# Altium project Oliver_Flst.PrjPcb
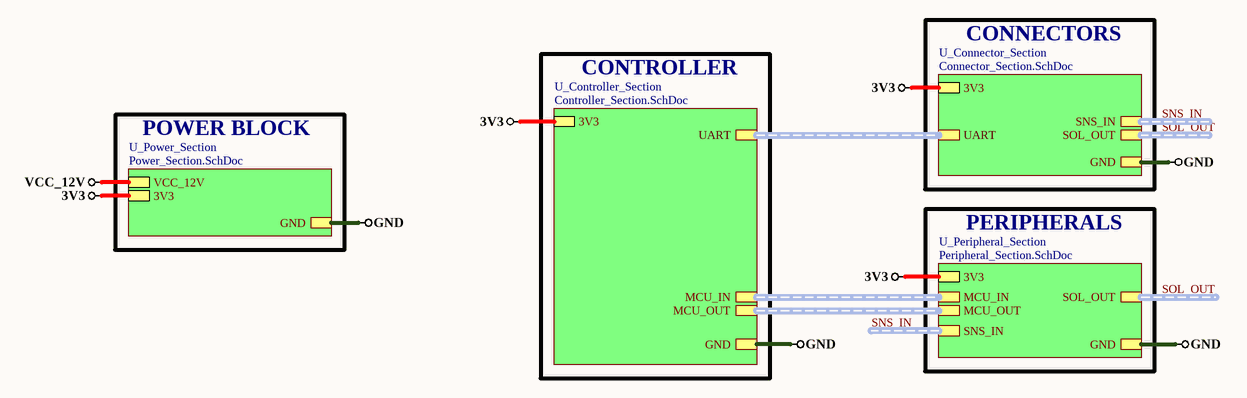
[diagram p0: Top_Sheet.SchDoc]
5 sheets, 47 parts. Net scope: global (net labels, ports and power ports of the same name join across sheets).
Board file: Junction_Box.PcbDoc
Sheets:
  Top_Sheet.SchDoc
    U_Controller_Section = Controller_Section.SchDoc
    U_Peripheral_Section = Peripheral_Section.SchDoc
    U_Power_Section = Power_Section.SchDoc
    U_Connector_Section = Connector_Section.SchDoc

## Sheet Top_Sheet.SchDoc
size A4; DocumentNumber: 1; SheetNumber: 1

### Sub-sheets
U_Connector_Section = Connector_Section.SchDoc: UART (harness UART), 3V3, GND, SNS_IN (harness SNS_IN), SOL_OUT (harness SOL_OUT)
U_Controller_Section = Controller_Section.SchDoc: 3V3, GND, UART (harness UART), MCU_OUT (harness MCU_OUT), MCU_IN (harness MCU_IN)
U_Peripheral_Section = Peripheral_Section.SchDoc: MCU_IN (harness MCU_IN), MCU_OUT (harness MCU_OUT), 3V3, GND, SNS_IN (harness SNS_IN), SOL_OUT (harness SOL_OUT)
U_Power_Section = Power_Section.SchDoc: 3V3, GND, VCC_12V

### Nets
3V3: sheet U_Controller_Section/3V3, sheet U_Peripheral_Section/3V3, sheet U_Power_Section/3V3, sheet U_Connector_Section/3V3
GND: sheet U_Controller_Section/GND, sheet U_Peripheral_Section/GND, sheet U_Power_Section/GND, sheet U_Connector_Section/GND
VCC_12V: sheet U_Power_Section/VCC_12V

### Buses and harness runs
harness sheet U_Connector_Section/UART = sheet U_Controller_Section/UART
harness sheet U_Controller_Section/MCU_IN = sheet U_Peripheral_Section/MCU_IN
harness sheet U_Controller_Section/MCU_OUT = sheet U_Peripheral_Section/MCU_OUT
harness SNS_IN = sheet U_Connector_Section/SNS_IN
harness SNS_IN = sheet U_Peripheral_Section/SNS_IN
harness SOL_OUT = sheet U_Connector_Section/SOL_OUT
harness SOL_OUT = sheet U_Peripheral_Section/SOL_OUT

### Notes on the sheet
- CONTROLLER
- CONNECTORS
- POWER BLOCK
- PERIPHERALS

## Sheet Controller_Section.SchDoc
size A4; DocumentNumber: 3; SheetNumber: 3
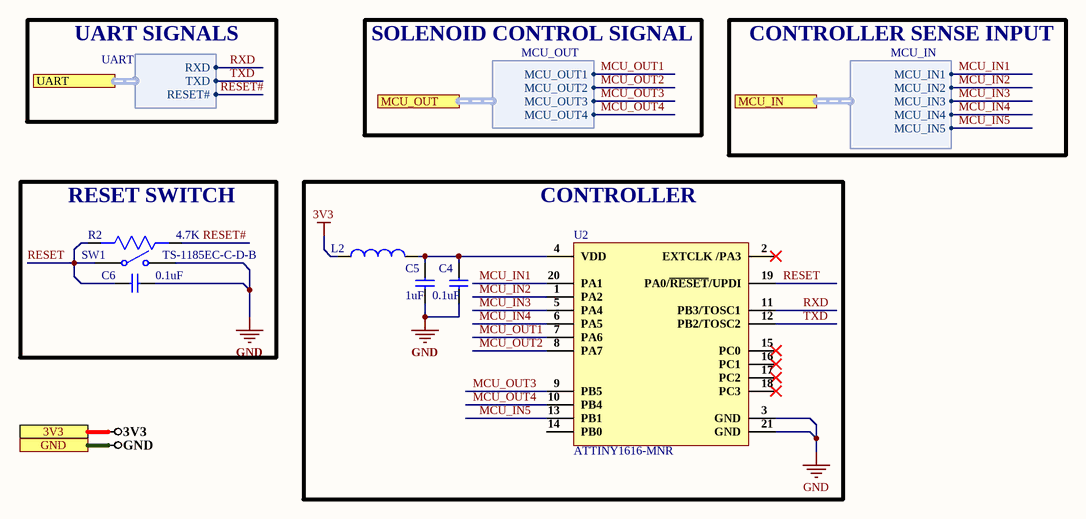
[diagram p1: Controller_Section.SchDoc]

### Parts
C4  0.1uF  [Cap0603]
C5  1uF  [Cap0603]
C6  0.1uF  [Cap0603]
L2  MMZ0603S601CT000  [IND 0201]  (value not drawn)
R2  4.7K  [RES-0603]
SW1  TS-1185EC-C-D-B  [TS-1185EC-C-D-B]
U2  ATTINY1616-MNR  [20-QFN]

### Blocks framed on the sheet
RESET SWITCH: C6 R2 SW1
CONTROLLER: C4 C5 L2 U2

### Ports
3V3, GND, MCU_IN (harness MCU_IN), MCU_OUT (harness MCU_OUT), UART (harness UART)

### Harnesses
UART: RXD, TXD, RESET#
MCU_IN: MCU_IN1, MCU_IN2, MCU_IN3, MCU_IN4, MCU_IN5
MCU_OUT: MCU_OUT1, MCU_OUT2, MCU_OUT3, MCU_OUT4

### Nets
3V3: L2.1 ; port 3V3
GND: C4.1 C5.1 C6.2 SW1.2 U2.3(GND) U2.21(GND) ; port GND
MCU_IN1: U2.20(PA1) ; port MCU_IN.MCU_IN1
MCU_IN2: U2.1(PA2) ; port MCU_IN.MCU_IN2
MCU_IN3: U2.5(PA4) ; port MCU_IN.MCU_IN3
MCU_IN4: U2.6(PA5) ; port MCU_IN.MCU_IN4
MCU_IN5: U2.13(PB1) ; port MCU_IN.MCU_IN5
MCU_OUT1: U2.7(PA6) ; port MCU_OUT.MCU_OUT1
MCU_OUT2: U2.8(PA7) ; port MCU_OUT.MCU_OUT2
MCU_OUT3: U2.9(PB5) ; port MCU_OUT.MCU_OUT3
MCU_OUT4: U2.10(PB4) ; port MCU_OUT.MCU_OUT4
RESET: C6.1 R2.2 SW1.1 U2.19(PA0/~{RESET}/UPDI)
RESET#: R2.1 ; port UART.RESET#
RXD: U2.11(PB3/TOSC1) ; port UART.RXD
TXD: U2.12(PB2/TOSC2) ; port UART.TXD
NetC4_2: C4.2 C5.2 L2.2 U2.4(VDD)

Not connected (* = marked no-connect by the designer): U2 2(EXTCLK_/PA3)* 14(PB0) 15(PC0)* 16(PC1)* 17(PC2)* 18(PC3)*

### Notes on the sheet
- UART SIGNALS
- SOLENOID CONTROL SIGNAL
- CONTROLLER SENSE INPUT

### Library data of the parts
C4 C6 = CC0603ZRY5V9BB104: CAP CER 0.1UF 50V Y5V 0603; Manufacturer: Yageo; Capacitance: 100nF; Tolerance: 80%; Supplier 1: Digi-Key; Manufacturer Part Number: CC0603ZRY5V9BB104; Stock 1: 15000880; Pricing 1: 1=0.1, 10=0.075, 100=0.0334, 500=0.02386, 1000=0.01874 (USD); Mount: Surface Mount; Case/Package: 0603; Number of Pins: 2; Case Code (Metric): 1608; Case Code (Imperial): 0603; Min Operating Temperature: -30°C; Max Operating Temperature: 85°C; Dielectric: Y5V; Voltage Rating: 50V; Package Quantity: 1; Packaging: Tape and Reel; Voltage Rating (DC): 50V; Termination: SMD/SMT; Composition: Ceramic; Voltage: 50V; Length: 1.6mm; Height: 0.8mm; Width: 0.031inch; Thickness: 0.035inch; Depth: 0.8mm; Radiation Hardening: No; REACH SVHC: No SVHC; Lead Free: Lead Free; Halogen Free: Halogen Free; ComponentLink1URL: http://www.yageo.com/documents/recent/UPY-GPHC_Y5V_6.3V-to-50V_8.pdf?src-supplier=Digi-Key; ComponentLink1Description: http://www.yageo.com/documents/recent/UPY-GPHC_Y5V_6.3V-to-50V_8.pdf?src-supplier=Digi-Key; ComponentLink2URL: http://www.yageo.com/documents/recent/UPY-GPHC_Y5V_6.3V-to-50V_5.pdf?src-supplier=Avnet+Europe; ComponentLink2Description: http://www.yageo.com/documents/recent/UPY-GPHC_Y5V_6.3V-to-50V_5.pdf?src-supplier=Avnet+Europe; ComponentLink3URL: https://www.verical.com/server-webapp/html/getDatasheet?partID=403611&src-supplier=Verical; ComponentLink3Description: https://www.verical.com/server-webapp/html/getDatasheet?partID=403611&src-supplier=Verical; ComponentLink4URL: http://www.mouser.com/ds/2/447/Yageo_UPY-GP_NP0_16V-to-50V_9-358835.pdf?src-supplier=Mouser; ComponentLink4Description: http://www.mouser.com/ds/2/447/Yageo_UPY-GP_NP0_16V-to-50V_9-358835.pdf?src-supplier=Mouser; ComponentLink5URL: http://www.farnell.com/datasheets/1132289.pdf?src-supplier=Element14; ComponentLink5Description: http://www.farnell.com/datasheets/1132289.pdf?src-supplier=Element14; Supplier Part Number 1: 311-1343-1-ND
C5 = CC0603KRX5R8BB105: CAP CER 1UF 25V X5R 0603; Manufacturer: Yageo; Tolerance: 10%; Supplier 1: Digi-Key; Manufacturer Part Number: CC0603KRX5R8BB105; Stock 1: 1419041; Pricing 1: 1=0.1, 10=0.069, 100=0.0307, 500=0.0219, 1000=0.0172 (USD); Mount: Surface Mount; Case/Package: 0603; Number of Pins: 2; Case Code (Metric): 1608; Case Code (Imperial): 0603; Min Operating Temperature: -55°C; Max Operating Temperature: 85°C; Capacitance: 1uF; Dielectric: X5R; Package Quantity: 1; Voltage Rating: 25V; Packaging: Tape and Reel; Termination: SMD/SMT; Voltage Rating (DC): 25V; Length: 1.6mm; Height: 0.8mm; Width: 0.031inch; Thickness: 0.035inch; Depth: 0.8mm; Radiation Hardening: No; REACH SVHC: No SVHC; Lead Free: Lead Free; Halogen Free: Halogen Free; ComponentLink1URL: http://www.yageo.com/documents/recent/UPY-GPHC_X5R_4V-to-50V_25.pdf?src-supplier=Digi-Key; ComponentLink1Description: http://www.yageo.com/documents/recent/UPY-GPHC_X5R_4V-to-50V_25.pdf?src-supplier=Digi-Key; ComponentLink2URL: http://www.yageo.com/documents/recent/UPY-GPHC_X5R_4V-to-50V_12.pdf?src-supplier=Avnet+Europe; ComponentLink2Description: http://www.yageo.com/documents/recent/UPY-GPHC_X5R_4V-to-50V_12.pdf?src-supplier=Avnet+Europe; ComponentLink3URL: http://www.farnell.com/datasheets/1525783.pdf?src-supplier=Element14; ComponentLink3Description: http://www.farnell.com/datasheets/1525783.pdf?src-supplier=Element14; ComponentLink4URL: http://www.yageo.com/documents/recent/UPY-GPHC_X5R_4V-to-50V_12.pdf?src-supplier=Avnet; ComponentLink4Description: http://www.yageo.com/documents/recent/UPY-GPHC_X5R_4V-to-50V_12.pdf?src-supplier=Avnet; Supplier Part Number 1: 311-1445-6-ND
L2 = MMZ0603S601CT000: FERRITE BEAD 600 OHM 0201 1LN; Manufacturer: TDK; Impedance: 600R; Tolerance: 25%; DC Resistance (DCR): 1.45R; Max DC Current: 100mA; Supplier 1: Digi-Key; Manufacturer Part Number: MMZ0603S601CT000; RoHS: Yes; Category: Inductors; Stock 1: 1540; Pricing 1: 1=0.12000, 10=0.09900, 25=0.07680, 50=0.06380, 100=0.05500, 250=0.04400, 500=0.03960, 1000=0.03300, 5000=0.03080 (USD); Mount: Surface Mount; Case/Package: 0201; Core Material: Ferrite; Case Code (Metric): 0603; Case Code (Imperial): 0201; Packaging: Cut Tape; Package Quantity: 15000; Current Rating: 100mA; Length: 0.024inch; Width: 0.012inch; Height: 0.013inch; REACH SVHC: No SVHC; Lead Free: Lead Free; RoHS Compliant: Yes; ComponentLink1URL: https://datasheet.ciiva.com/46381/1795294-46381669.pdf?src-supplier=Element14; ComponentLink1Description: https://datasheet.ciiva.com/46381/1795294-46381669.pdf?src-supplier=Element14; ComponentLink2URL: https://datasheet.ciiva.com/46634/beads-commercial-signal-mmz-en-46634390.pdf?src-supplier=Digi-Key; ComponentLink2Description: https://datasheet.ciiva.com/46634/beads-commercial-signal-mmz-en-46634390.pdf?src-supplier=Digi-Key; ComponentLink3URL: https://datasheet.ciiva.com/48682/beads-commercial-signal-mmz-en-48682603.pdf?src-supplier=Avnet; ComponentLink3Description: https://datasheet.ciiva.com/48682/beads-commercial-signal-mmz-en-48682603.pdf?src-supplier=Avnet; ComponentLink4URL: https://datasheet.ciiva.com/46634/beads-commercial-signal-mmz-en-46634381.pdf?src-supplier=Digi-Key; ComponentLink4Description: https://datasheet.ciiva.com/46634/beads-commercial-signal-mmz-en-46634381.pdf?src-supplier=Digi-Key; Supplier Part Number 1: 445-2146-1-ND
R2 = RC0603FR-074K7L: RES SMD 4.7K OHM 1% 1/10W 0603; Manufacturer: Yageo; Resistance: 4.7kR; Temperature Coefficient: 100ppm/°C; Power Rating: 100mW; Voltage Rating (DC): 50V; Supplier 1: Digi-Key; Manufacturer Part Number: RC0603FR-074K7L; RoHS: Yes; Category: Chip SMD Resistors; Stock 1: 1924316; Pricing 1: 1=0.10000, 10=0.02400, 100=0.00970, 1000=0.00436, 2500=0.00378 (USD); Case/Package: 0603; Number of Pins: 2; Case Code (Imperial): 0603; Case Code (Metric): 1608; Size Code: 0603; Min Operating Temperature: -55°C; Max Operating Temperature: 155°C; Tolerance: 1%; Resistor Type: Thick Film; Packaging: Tape and Reel; Voltage Rating: 50V; Termination: SMD/SMT; Features: Moisture Resistant; Series: RC; Max Power Dissipation: 100mW; Number of Terminations: 2; Construction: Rectangular; Resistance Tolerance: 1%; Length: 1.6mm; Width: 0.8mm; Height: 0.45mm; Depth: 0.8mm; Lead Pitch: 0.3mm; REACH SVHC: No SVHC; Lead Free: Lead Free; RoHS Compliant: Yes; Military Standard: Not; ComponentLink1URL: https://datasheet.ciiva.com/15189/getdatasheetpartid-422754-15189760.pdf?src-supplier=Verical; ComponentLink1Description: https://datasheet.ciiva.com/15189/getdatasheetpartid-422754-15189760.pdf?src-supplier=Verical; ComponentLink2URL: https://datasheet.ciiva.com/22747/443971-22747528.pdf?src-supplier=Element14; ComponentLink2Description: https://datasheet.ciiva.com/22747/443971-22747528.pdf?src-supplier=Element14; ComponentLink3URL: https://datasheet.ciiva.com/7660/38590-7660794.pdf?src-supplier=Element14; ComponentLink3Description: https://datasheet.ciiva.com/7660/38590-7660794.pdf?src-supplier=Element14; ComponentLink4URL: https://datasheet.ciiva.com/7746/1868787-7746365.pdf?src-supplier=Element14; ComponentLink4Description: https://datasheet.ciiva.com/7746/1868787-7746365.pdf?src-supplier=Element14; ComponentLink5URL: https://datasheet.ciiva.com/46440/1868787-46440909.pdf?src-supplier=Element14; ComponentLink5Description: https://datasheet.ciiva.com/46440/1868787-46440909.pdf?src-supplier=Element14; ComponentLink6URL: https://datasheet.ciiva.com/7746/1738695-7746366.pdf?src-supplier=Element14; ComponentLink6Description: https://datasheet.ciiva.com/7746/1738695-7746366.pdf?src-supplier=Element14; Supplier Part Number 1: 311-4.70KHRCT-ND
SW1 = TS-1185EC-C-D-B: 3mm 2mm Round Button 50mA Top3.65mm SPST 12V SMD Tactile Switches; Manufacturer: XKB; Manufacturer Part No: TS-1185EC-C-D-B; Package: Custom; ComponentLink1Description: LCSC; ComponentLink1URL: https://lcsc.com/product-detail/Tactile-Switches_XKB-Connectivity-TS-1185EC-C-D-B_C318893.html
U2 = ATTINY1616-MNR: IC MCU 8BIT 16KB FLASH 20VQFN; Manufacturer: Microchip; Interface: I2C,SPI,IrDA,UART,USART; Peripherals: Brown-out Detect/Reset,POR,PWM,WDT; Core Architecture: AVR; Frequency: 20MHz; Number of I/Os: 18; Oscillator Type: Internal; Supplier 1: Digi-Key; Manufacturer Part Number: ATTINY1616-MNR; RoHS: No; Category: Microcontrollers; Stock 1: 3963; Pricing 1: 1=0.75000, 25=0.69000, 100=0.62000 (USD); Case/Package: VQFN; Min Operating Temperature: -40°C; Max Operating Temperature: 105°C; Memory Type: FLASH; Packaging: Cut Tape; Memory Size: 16KB; ComponentLink1URL: http://www.microchip.com/mymicrochip/filehandler.aspx?ddocname=en606269&src-supplier=Digi-Key; ComponentLink1Description: http://www.microchip.com/mymicrochip/filehandler.aspx?ddocname=en606269&src-supplier=Digi-Key; Supplier Part Number 1: ATTINY1616-MNRCT-ND

## Sheet Peripheral_Section.SchDoc
size A4; DocumentNumber: 4; SheetNumber: 4
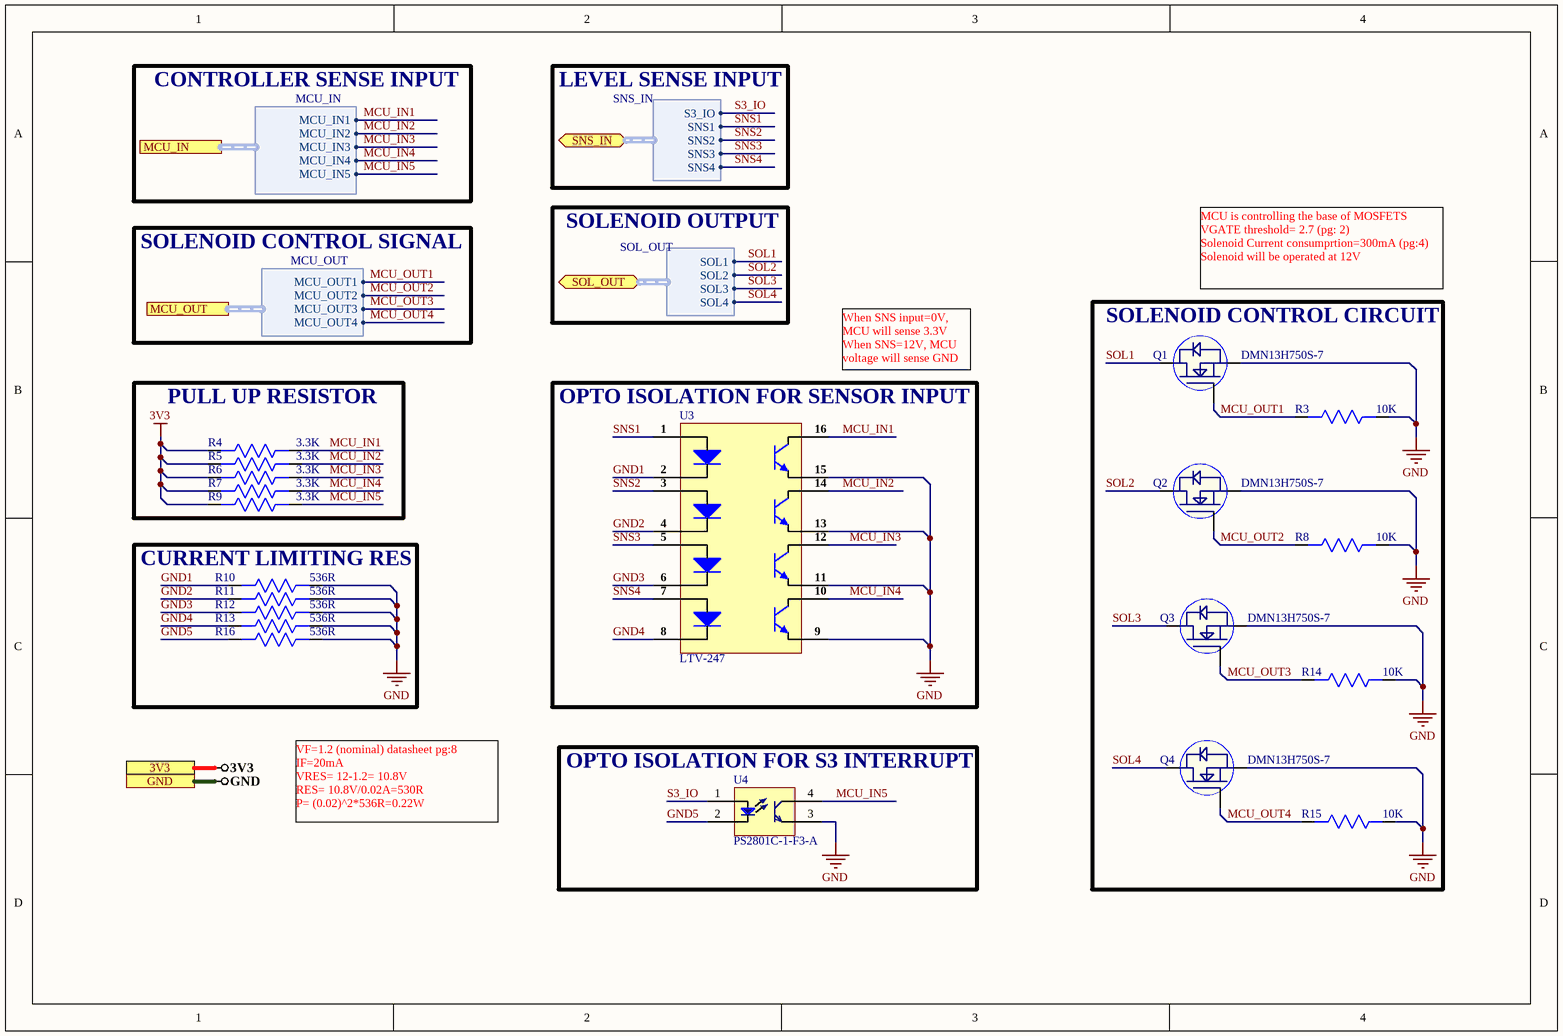
[diagram p2: Peripheral_Section.SchDoc]

### Parts
Q1  DMN13H750S-7  [SOT23-3]
Q2  DMN13H750S-7  [SOT23-3]
Q3  DMN13H750S-7  [SOT23-3]
Q4  DMN13H750S-7  [SOT23-3]
R3  10K  [Res-0201]
R4  3.3K  [RES-0603]
R5  3.3K  [RES-0603]
R6  3.3K  [RES-0603]
R7  3.3K  [RES-0603]
R8  10K  [Res-0201]
R9  3.3K  [RES-0603]
R10  536R  [Res-1206]
R11  536R  [Res-1206]
R12  536R  [Res-1206]
R13  536R  [Res-1206]
R14  10K  [Res-0201]
R15  10K  [Res-0201]
R16  536R  [Res-1206]
U3  LTV-247  [LTV-247]
U4  PS2801C-1-F3-A  [PS2801C-1-F3-A]

### Blocks framed on the sheet
SOLENOID CONTROL CIRCUIT: Q1-Q4 R3 R8 R14 R15
PULL UP RESISTOR: R4-R7 R9
OPTO ISOLATION FOR SENSOR INPUT: U3
CURRENT LIMITING RES: R10-R13 R16
OPTO ISOLATION FOR S3 INTERRUPT: U4

### Ports
3V3, GND, MCU_IN (harness MCU_IN), MCU_OUT (harness MCU_OUT), SNS_IN (bidir, harness SNS_IN), SOL_OUT (bidir, harness SOL_OUT)

### Harnesses
MCU_IN: MCU_IN1, MCU_IN2, MCU_IN3, MCU_IN4, MCU_IN5
MCU_OUT: MCU_OUT1, MCU_OUT2, MCU_OUT3, MCU_OUT4
SNS_IN: S3_IO, SNS1, SNS2, SNS3, SNS4
SOL_OUT: SOL1, SOL2, SOL3, SOL4

### Nets
3V3: R4.2 R5.2 R6.2 R7.2 R9.2 ; port 3V3
GND: Q1.2(S) Q2.2(S) Q3.2(S) Q4.2(S) R3.1 R8.1 R10.1 R11.1 R12.1 R13.1 R14.1 R15.1 R16.1 U3.9(E) U3.11(E) U3.13(E) U3.15(E) U4.3(E) ; port GND
GND1: R10.2 U3.2(K)
GND2: R11.2 U3.4(K)
GND3: R12.2 U3.6(K)
GND4: R13.2 U3.8(K)
GND5: R16.2 U4.2(Ca)
MCU_IN1: R4.1 U3.16(C) ; port MCU_IN.MCU_IN1
MCU_IN2: R5.1 U3.14(C) ; port MCU_IN.MCU_IN2
MCU_IN3: R6.1 U3.12(C) ; port MCU_IN.MCU_IN3
MCU_IN4: R7.1 U3.10(C) ; port MCU_IN.MCU_IN4
MCU_IN5: R9.1 U4.4(C) ; port MCU_IN.MCU_IN5
MCU_OUT1: Q1.1(G) R3.2 ; port MCU_OUT.MCU_OUT1
MCU_OUT2: Q2.1(G) R8.2 ; port MCU_OUT.MCU_OUT2
MCU_OUT3: Q3.1(G) R14.2 ; port MCU_OUT.MCU_OUT3
MCU_OUT4: Q4.1(G) R15.2 ; port MCU_OUT.MCU_OUT4
S3_IO: U4.1(An) ; port SNS_IN.S3_IO
SNS1: U3.1(A) ; port SNS_IN.SNS1
SNS2: U3.3(A) ; port SNS_IN.SNS2
SNS3: U3.5(A) ; port SNS_IN.SNS3
SNS4: U3.7(A) ; port SNS_IN.SNS4
SOL1: Q1.3(D) ; port SOL_OUT.SOL1
SOL2: Q2.3(D) ; port SOL_OUT.SOL2
SOL3: Q3.3(D) ; port SOL_OUT.SOL3
SOL4: Q4.3(D) ; port SOL_OUT.SOL4

### Notes on the sheet
- CONTROLLER SENSE INPUT
- LEVEL SENSE INPUT
- SOLENOID CONTROL SIGNAL
- SOLENOID OUTPUT
- MCU is controlling the base of MOSFETS
  VGATE threshold= 2.7 (pg: 2)
  Solenoid Current consumprtion=300mA (pg:4)
  Solenoid will be operated at 12V
- When SNS input=0V, MCU will sense 3.3V
  When SNS=12V, MCU voltage will sense GND
- VF=1.2 (nominal) datasheet pg:8
  IF=20mA
  VRES= 12-1.2= 10.8V
  RES= 10.8V/0.02A=530R
  P= (0.02)^2*536R=0.22W

### Library data of the parts
Q1-Q4 = DMN13H750S-7: MOSFET N-CH 130V 1A SOT23; Manufacturer: Diodes; Rds On Max: 750mR; Input Capacitance: 231pF; Max Power Dissipation: 770mW; Supplier 1: Digi-Key; Manufacturer Part Number: DMN13H750S-7; Stock 1: 5815; Pricing 1: 1=0.53, 10=0.455, 25=0.4244, 100=0.3151, 250=0.29936, 500=0.24604, 1000=0.19998 (USD); Mount: Surface Mount; Case/Package: TO-236-3; Min Operating Temperature: -55°C; Max Operating Temperature: 150°C; Packaging: Tape and Reel; Drain to Source Voltage (Vdss): 130V; Continuous Drain Current (ID): 1A; ComponentLink1URL: https://www.diodes.com/assets/Datasheets/DMN13H750S.pdf?src-supplier=Digi-Key; ComponentLink1Description: https://www.diodes.com/assets/Datasheets/DMN13H750S.pdf?src-supplier=Digi-Key; ComponentLink2URL: http://www.mouser.com/ds/2/115/DMN13H750S-526254.pdf?src-supplier=Mouser; ComponentLink2Description: http://www.mouser.com/ds/2/115/DMN13H750S-526254.pdf?src-supplier=Mouser; Supplier Part Number 1: DMN13H750S-7DICT-ND
R3 R8 R14 R15 = RC0201FR-0710KL: RES SMD 10K OHM 1% 1/20W 0201; Manufacturer: Yageo; Resistance: 10kR; Temperature Coefficient: 200ppm/°C; Power Rating: 50mW; Voltage Rating: 25V; Supplier 1: Digi-Key; Manufacturer Part Number: RC0201FR-0710KL; Stock 1: 12729696; Pricing 1: 1=0.1, 10=0.042, 100=0.0171, 1000=0.00768, 2500=0.00666, 5000=0.00551 (USD); Case/Package: 0201; Number of Pins: 2; Weight: 6E-06oz; Contact Plating: Tin,Matte; Case Code (Imperial): 0201; Case Code (Metric): 0603; Min Operating Temperature: -55°C; Max Operating Temperature: 125°C; Tolerance: 1%; Composition: Thick Film; Packaging: Tape and Reel; Package Quantity: 1; Termination: SMD/SMT; Number of Terminations: 2; Military Standard: Not; Max Power Dissipation: 50mW; Voltage Rating (DC): 25V; Working Voltage: 25V; Features: Moisture Resistant; Length: 0.6mm; Height: 0.01inch; Width: 0.3mm; Depth: 0.3mm; Radiation Hardening: No; REACH SVHC: No SVHC; Lead Free: Lead Free; ComponentLink1URL: http://www.yageo.com/documents/recent/PYu-RC_Group_51_RoHS_L_10.pdf?src-supplier=Digi-Key; ComponentLink1Description: http://www.yageo.com/documents/recent/PYu-RC_Group_51_RoHS_L_10.pdf?src-supplier=Digi-Key; ComponentLink2URL: http://www.farnell.com/datasheets/2167052.pdf?src-supplier=Element14; ComponentLink2Description: http://www.farnell.com/datasheets/2167052.pdf?src-supplier=Element14; ComponentLink3URL: http://www.yageo.com/documents/recent/PYu-RC0201_51_RoHS_L_8.pdf?src-supplier=Avnet; ComponentLink3Description: http://www.yageo.com/documents/recent/PYu-RC0201_51_RoHS_L_8.pdf?src-supplier=Avnet; ComponentLink4URL: http://www.yageo.com/documents/recent/PYu-RC0201_51_RoHS_L_8.pdf?src-supplier=Avnet+Europe; ComponentLink4Description: http://www.yageo.com/documents/recent/PYu-RC0201_51_RoHS_L_8.pdf?src-supplier=Avnet+Europe; ComponentLink5URL: https://www.verical.com/server-webapp/html/getDatasheet?partID=421074&src-supplier=Verical; ComponentLink5Description: https://www.verical.com/server-webapp/html/getDatasheet?partID=421074&src-supplier=Verical; ComponentLink6URL: http://www.farnell.com/datasheets/1421516.pdf?src-supplier=Element14; ComponentLink6Description: http://www.farnell.com/datasheets/1421516.pdf?src-supplier=Element14; Supplier Part Number 1: 311-10.0KMCT-ND
R4-R7 R9 = RC0603FR-073K3L: RES SMD 3.3K OHM 1% 1/10W 0603; Manufacturer: Yageo Phycomp; Temperature Coefficient: 100ppm/°C; Resistance: 3.3kR; Voltage Rating (DC): 50V; Power Rating: 100mW; Supplier 1: Digi-Key; Manufacturer Part Number: RC0603FR-073K3L; Stock 1: 6863000; Pricing 1: 1=0.1, 10=0.024, 100=0.0097, 1000=0.00437, 2500=0.00379 (USD); Mount: Surface Mount; Case/Package: 0603; Number of Pins: 2; Min Operating Temperature: -55°C; Max Operating Temperature: 155°C; Tolerance: 1%; Packaging: Cut Tape; Length: 1.6mm; Height: 0.45mm; Width: 800um; Depth: 0.8mm; REACH SVHC: No SVHC; Lead Free: Lead Free; Supplier Part Number 1: 311-3.30KHRCT-ND
R10-R13 = AC1206FR-07536RL: Chip Resistor Automotive Grade Thick Film 1206 536Ohm 1% Paper T/R; Manufacturer: Yageo; Max Power Dissipation: 250mW; Temperature Coefficient: 100ppm/°C; Supplier 1: Avnet; Manufacturer Part Number: AC1206FR-07536RL; RoHS: Yes; Category: Chip SMD Resistors; Pricing 1: 5000=0.00554, 10000=0.00547, 20000=0.00531 (USD); Case/Package: 1206; Min Operating Temperature: -55°C; Max Operating Temperature: 155°C; Packaging: Tape and Reel; Resistance: 536R; Resistor Type: Thick Film; Number of Terminations: 2; Tolerance: 1%; Features: Moisture Resistant,Automotive AEC-Q200; Length: 0.122inch; Width: 0.063inch; Height: 0.026inch; RoHS Compliant: Yes; ComponentLink1URL: http://www.yageo.com/NewPortal/yageodocoutput?fileName=/pdf/R-Chip/PYu-AC_51_RoHS_L_6.pdf&src-supplier=Digi-Key; ComponentLink1Description: http://www.yageo.com/NewPortal/yageodocoutput?fileName=/pdf/R-Chip/PYu-AC_51_RoHS_L_6.pdf&src-supplier=Digi-Key; Supplier Part Number 1: AC1206FR-07536RL
R16 = AC1206FR-07536RL: RES SMD 1206 536Ohm 1% Paper T/R; Manufacturer: Yageo; Max Power Dissipation: 250mW; Temperature Coefficient: 100ppm/°C; Supplier 1: Avnet; Manufacturer Part Number: AC1206FR-07536RL; RoHS: Yes; Category: Chip SMD Resistors; Pricing 1: 5000=0.00554, 10000=0.00547, 20000=0.00531 (USD); Case/Package: 1206; Min Operating Temperature: -55°C; Max Operating Temperature: 155°C; Packaging: Tape and Reel; Resistance: 536R; Resistor Type: Thick Film; Number of Terminations: 2; Tolerance: 1%; Features: Moisture Resistant,Automotive AEC-Q200; Length: 0.122inch; Width: 0.063inch; Height: 0.026inch; RoHS Compliant: Yes; ComponentLink1URL: http://www.yageo.com/NewPortal/yageodocoutput?fileName=/pdf/R-Chip/PYu-AC_51_RoHS_L_6.pdf&src-supplier=Digi-Key; ComponentLink1Description: http://www.yageo.com/NewPortal/yageodocoutput?fileName=/pdf/R-Chip/PYu-AC_51_RoHS_L_6.pdf&src-supplier=Digi-Key; Supplier Part Number 1: AC1206FR-07536RL
U3 = LTV-247: OPTOISO 3.75KV 4CH TRANS 16SO; Manufacturer: Vishay Lite-On; Number of Channels: 4; Collector Emitter Voltage (VCEO): 80V; Reverse Breakdown Voltage: 6V; Forward Voltage: 1.2V; Forward Current: 20mA; Max Power Dissipation: 200mW; Output Current per Channel: 50mA; Collector Emitter Saturation Voltage: 400mV; Power Dissipation: 170mW; Current Transfer Ratio: 600%; Supplier 1: Future Electronics; Manufacturer Part Number: LTV-247; RoHS: Yes; Category: Optocouplers; Stock 1: 178000; Pricing 1: 2000=0.77000 (USD); Mount: Surface Mount; Case/Package: SMD/SMT; Number of Pins: 16; Min Operating Temperature: -55°C; Max Operating Temperature: 110°C; Package Quantity: 2000; Packaging: Tape and Reel; Max Output Voltage: 80V; Max Collector Current: 50mA; Number of Elements: 4; Max Input Current: 50mA; Radiation Hardening: No; RoHS Compliant: Yes; ComponentLink1URL: https://datasheet.ciiva.com/24015/ltv-247-256860-24015561.pdf?src-supplier=Mouser; ComponentLink1Description: https://datasheet.ciiva.com/24015/ltv-247-256860-24015561.pdf?src-supplier=Mouser; ComponentLink2URL: https://datasheet.ciiva.com/29730/ltv-214-244-29730320.pdf?src-supplier=Digi-Key; ComponentLink2Description: https://datasheet.ciiva.com/29730/ltv-214-244-29730320.pdf?src-supplier=Digi-Key; Supplier Part Number 1: 3051235
U4 = PS2801C-1-F3-A: TransistorOptocouplers DC 1 2500Vrms SOP-4_P1.27 Optocouplers RoHS; Manufacturer: CEL; Number of Channels: 1; Collector Emitter Voltage (VCEO): 300mV; Forward Voltage: 1.2V; Max Power Dissipation: 120mW; Max Collector Current: 30mA; Max Output Voltage: 80V; Supplier 1: Digi-Key; Manufacturer Part Number: PS2801C-1-F3-A; Stock 1: 399; Pricing 1: 1=0.77, 10=0.595, 100=0.3825 (USD); Mount: Surface Mount; Case/Package: SOIC; Number of Pins: 4; Min Operating Temperature: -55°C; Max Operating Temperature: 100°C; Packaging: Tape and Reel; Collector Emitter Saturation Voltage: 300mV; Package Quantity: 1; Output Current per Channel: 30mA; Lead Free: Lead Free; ComponentLink1URL: http://www.cel.com/pdf/datasheets/PS2801C-1,PS2801C-4.pdf?src-supplier=Digi-Key; ComponentLink1Description: http://www.cel.com/pdf/datasheets/PS2801C-1,PS2801C-4.pdf?src-supplier=Digi-Key; ComponentLink2URL: http://www.cel.com/pdf/datasheets/how_to_order_optos.pdf?src-supplier=Digi-Key; ComponentLink2Description: http://www.cel.com/pdf/datasheets/how_to_order_optos.pdf?src-supplier=Digi-Key; ComponentLink3URL: http://datasheet.iiic.cc/cel/PS2801C-1-F3-A.pdf?src-supplier=IIIC; ComponentLink3Description: http://datasheet.iiic.cc/cel/PS2801C-1-F3-A.pdf?src-supplier=IIIC; Supplier Part Number 1: PS2801C-1-F3-ACT-ND

## Sheet Power_Section.SchDoc
size A4; DocumentNumber: 2; SheetNumber: 2
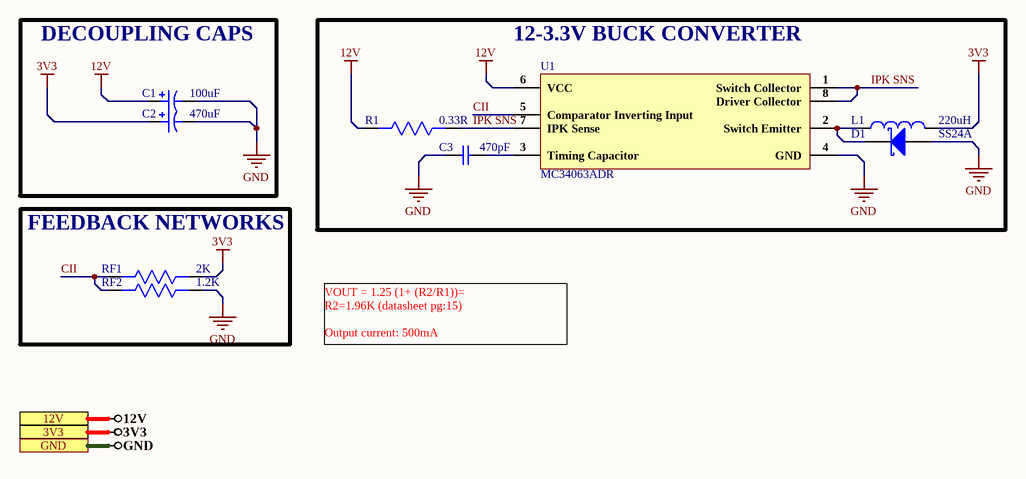
[diagram p3: Power_Section.SchDoc]

### Parts
C1  100uF  [CAP- 2917]
C2  470uF  [VT1H471MI135000CE0]
C3  470pF  [Cap0603]
D1  SS24A  [SMA]
L1  220uH  [SLF12575T-221M1R3-PF]
R1  0.33R  [RES-0603]
RF1  2K  [RES-0603]
RF2  1.2K  [RES-0603]
U1  MC34063ADR  [SOIC-8]

### Blocks framed on the sheet
DECOUPLING CAPS: C1 C2
12-3.3V BUCK CONVERTER: C3 D1 L1 R1 U1
FEEDBACK NETWORKS: RF1 RF2

### Ports
3V3, 12V, GND

### Nets
3V3: C2.1 L1.2 RF1.1 ; port 3V3
12V: C1.1 R1.2 U1.6(VCC) ; port 12V
GND: C1.2 C2.2 C3.1 D1.2(A) RF2.1 U1.4(GND) ; port GND
CII: RF1.2 RF2.2 U1.5(Comparator_Inverting_Input)
IPK SNS: R1.1 U1.1(Switch_Collector) U1.7(IPK_Sense) U1.8(Driver_Collector)
NetC3_2: C3.2 U1.3(Timing_Capacitor)
NetD1_1: D1.1(K) L1.1 U1.2(Switch_Emitter)

### Notes on the sheet
- VOUT = 1.25 (1+ (R2/R1))=
  R2=1.96K (datasheet pg:15)
  Output current: 500mA

### Library data of the parts
C1 = TAJE107M025RNJ: CAP TANT 100UF 20% 25V 2917; Manufacturer: Kyocera AVX; ESR (Equivalent Series Resistance): 300mR; Leakage Current: 25uA; Polarity: Polar; Dissipation Factor: 10%; Supplier 1: Mouser; Manufacturer Part Number: TAJE107M025RNJ; RoHS: Yes; Category: Tantalum Capacitors; Stock 1: 109; Pricing 1: 1=2.81000, 10=2.81000, 50=2.81000, 100=2.19000, 1000=1.76000, 10000=1.76000 (USD); Mount: Surface Mount; Case/Package: 2917; Number of Pins: 2; Case Code (Imperial): 2917; Case Code (Metric): 7343; Min Operating Temperature: -55°C; Max Operating Temperature: 125°C; Capacitance: 100uF; Tolerance: 20%; Packaging: Tape and Reel; Voltage Rating: 25V; Voltage Rating (DC): 25V; Features: General Purpose; Package Quantity: 1; Termination: SMD/SMT; Series: TAJ; Construction: Flat; Length: 7.3mm; Width: 4.3mm; Height: 4.3mm; Depth: 4.3mm; Height - Seated (Max): 0.169inch; Radiation Hardening: No; Lead Free: Lead Free; RoHS Compliant: Yes; REACH SVHC: No SVHC; ComponentLink1URL: https://datasheet.ciiva.com/26787/taje107m025rnj-26787048.pdf?src-supplier=IIIC; ComponentLink1Description: https://datasheet.ciiva.com/26787/taje107m025rnj-26787048.pdf?src-supplier=IIIC; ComponentLink2URL: https://datasheet.ciiva.com/265/taj-265541.pdf?src-supplier=Digi-Key; ComponentLink2Description: https://datasheet.ciiva.com/265/taj-265541.pdf?src-supplier=Digi-Key; ComponentLink3URL: https://datasheet.ciiva.com/265/taj-265542.pdf?src-supplier=Digi-Key; ComponentLink3Description: https://datasheet.ciiva.com/265/taj-265542.pdf?src-supplier=Digi-Key; ComponentLink4URL: https://datasheet.ciiva.com/265/taj-265540.pdf?src-supplier=Digi-Key; ComponentLink4Description: https://datasheet.ciiva.com/265/taj-265540.pdf?src-supplier=Digi-Key; ComponentLink5URL: https://datasheet.ciiva.com/28609/1719052-28609254.pdf?src-supplier=Element14; ComponentLink5Description: https://datasheet.ciiva.com/28609/1719052-28609254.pdf?src-supplier=Element14; ComponentLink6URL: https://datasheet.ciiva.com/11230/taj-11230456.pdf?src-supplier=Avnet; ComponentLink6Description: https://datasheet.ciiva.com/11230/taj-11230456.pdf?src-supplier=Avnet; ComponentLink7URL: https://datasheet.ciiva.com/17339/taj-17339677.pdf?src-supplier=Avnet+Europe; ComponentLink7Description: https://datasheet.ciiva.com/17339/taj-17339677.pdf?src-supplier=Avnet+Europe; ComponentLink8URL: https://datasheet.ciiva.com/22667/1719052-22667581.pdf?src-supplier=Element14; ComponentLink8Description: https://datasheet.ciiva.com/22667/1719052-22667581.pdf?src-supplier=Element14; Supplier Part Number 1: 581-TAJE107M025RNJ
C2 = VT1H471MI135000CE0: 470uF ±20% 50V 12.5mm 13.5mm 1000hrs 105℃ -40℃~+105℃ SMD,12.5x13.5mm Aluminum Electrolytic Capacitors - SMD RoHS; Manufacturer: Changzhou Huawei Elec; Package: SMD,12.5x13.5mm; Capacitance: 470uF; Tolerance: ±20%; Rated Voltage: 50V; φD: 12.5mm; L: 13.5mm; Lifetime @ Temp: 1000hrs 105℃; Operating Temperature: -40℃~+105℃
C3 = CC0603KRX7R9BB471: CAP CER 470pF 10% X7R 50V 0603 SMD; Manufacturer: Yageo; Dielectric Material: Ceramic; Insulation Resistance: 10GR; Dissipation Factor: 2.5%; Supplier 1: Digi-Key; Manufacturer Part Number: CC0603KRX7R9BB471; RoHS: Yes; Category: Ceramic Capacitors; Stock 1: 2173; Pricing 1: 1=0.10000, 10=0.04500, 50=0.02460, 100=0.02010, 500=0.01432, 1000=0.01125 (USD); Mount: Surface Mount; Case/Package: 0603; Number of Pins: 2; Case Code (Imperial): 0603; Case Code (Metric): 1608; Min Operating Temperature: -55°C; Max Operating Temperature: 125°C; Capacitance: 470pF; Tolerance: 10%; Dielectric: X7R; Series: CC; Voltage Rating: 50V; Voltage Rating (DC): 50V; Packaging: Tape and Reel; Package Quantity: 1; Termination: SMD/SMT; Resistor Type: Ceramic; Length: 1.6mm; Width: 0.8mm; Height: 0.8mm; Depth: 0.8mm; Thickness: 0.035inch; Radiation Hardening: No; RoHS Compliant: Yes; REACH SVHC: No SVHC; Lead Free: Lead Free; Halogen Free: Halogen Free; ComponentLink1URL: https://datasheet.ciiva.com/5425/upy-gphc-x7r-6-3v-to-50v-8-12304-5425461.pdf?src-supplier=Mouser; ComponentLink1Description: https://datasheet.ciiva.com/5425/upy-gphc-x7r-6-3v-to-50v-8-12304-5425461.pdf?src-supplier=Mouser; ComponentLink2URL: https://datasheet.ciiva.com/144/mlccorderingcode-144439.pdf?src-supplier=Digi-Key; ComponentLink2Description: https://datasheet.ciiva.com/144/mlccorderingcode-144439.pdf?src-supplier=Digi-Key; ComponentLink3URL: https://datasheet.ciiva.com/144/mlccorderingcode-144440.pdf?src-supplier=Digi-Key; ComponentLink3Description: https://datasheet.ciiva.com/144/mlccorderingcode-144440.pdf?src-supplier=Digi-Key; ComponentLink4URL: https://datasheet.ciiva.com/11587/upy-gphc-x7r-6-3v-to-50v-8-11587224.pdf?src-supplier=Avnet; ComponentLink4Description: https://datasheet.ciiva.com/11587/upy-gphc-x7r-6-3v-to-50v-8-11587224.pdf?src-supplier=Avnet; ComponentLink5URL: https://datasheet.ciiva.com/144/mlccorderingcode-144441.pdf?src-supplier=Digi-Key; ComponentLink5Description: https://datasheet.ciiva.com/144/mlccorderingcode-144441.pdf?src-supplier=Digi-Key; ComponentLink6URL: https://datasheet.ciiva.com/16623/upy-gphc-x7r-6-3v-to-50v-8-16623897.pdf?src-supplier=Avnet+Europe; ComponentLink6Description: https://datasheet.ciiva.com/16623/upy-gphc-x7r-6-3v-to-50v-8-16623897.pdf?src-supplier=Avnet+Europe; ComponentLink7URL: https://datasheet.ciiva.com/8033/1489800-8033898.pdf?src-supplier=Element14; ComponentLink7Description: https://datasheet.ciiva.com/8033/1489800-8033898.pdf?src-supplier=Element14; ComponentLink8URL: https://datasheet.ciiva.com/8033/1489800-8033899.pdf?src-supplier=Element14; ComponentLink8Description: https://datasheet.ciiva.com/8033/1489800-8033899.pdf?src-supplier=Element14; ComponentLink9URL: https://datasheet.ciiva.com/26829/getdatasheetpartid-251791-26829452.pdf?src-supplier=Verical; ComponentLink9Description: https://datasheet.ciiva.com/26829/getdatasheetpartid-251791-26829452.pdf?src-supplier=Verical; ComponentLink10URL: https://datasheet.ciiva.com/28450/1489800-28450652.pdf?src-supplier=Element14; ComponentLink10Description: https://datasheet.ciiva.com/28450/1489800-28450652.pdf?src-supplier=Element14; ComponentLink11URL: https://datasheet.ciiva.com/8033/70765-8033902.pdf?src-supplier=Element14; ComponentLink11Description: https://datasheet.ciiva.com/8033/70765-8033902.pdf?src-supplier=Element14; Supplier Part Number 1: 311-1078-1-ND
D1 = SS24A: 40V 500mV@2A 2A SMA(DO-214AC) Schottky Barrier Diodes (SBD) ROHS; Manufacturer: Yangzhou; Manufacturer Part No: SS24A; Package: SMA(DO-214AC)
L1 = SLF12575T-221M1R3-PF: Inductor Power Shielded Wirewound 220uH 20% 1KHz Ferrite 1.3A 310mOhm DCR Blister T/R; Manufacturer: TDK; DC Resistance (DCR): 310mR; Supplier 1: Digi-Key; Manufacturer Part Number: SLF12575T-221M1R3-PF; RoHS: Yes; Category: Fixed Inductors; Stock 1: 1079; Pricing 1: 1=1.97000, 10=1.81500, 25=1.66360, 50=1.42180, 100=1.27050, 250=1.08900 (USD); Mount: Surface Mount; Case/Package: Nonstandard; Core Material: Ferrite; Min Operating Temperature: -20°C; Max Operating Temperature: 105°C; Package Quantity: 500; Packaging: Tape and Reel; Tolerance: 20%; Shielding: Shielded; Inductance: 220uH; Current Rating: 1.3A; Saturation Current: 1.3A; Max DC Current: 1.3A; Termination: SMD/SMT; Resistor Type: Wirewound; Test Frequency: 1kHz; DC Current: 1.3A; Series: SLF; Length: 12.5mm; Width: 12.5mm; Height: 0.295inch; Height - Seated (Max): 0.309inch; Depth: 12.8mm; Military Standard: Not; Lead Free: Lead Free; RoHS Compliant: Yes; ComponentLink1URL: https://datasheet.ciiva.com/11802/0900766b812b7d4f-11802208.pdf?src-supplier=RSComponents; ComponentLink1Description: https://datasheet.ciiva.com/11802/0900766b812b7d4f-11802208.pdf?src-supplier=RSComponents; Supplier Part Number 1: 445-174412-1-ND
R1 = RTT03R330FTP: 0.33Ω 0603 Chip Resistor - Surface Mount ROHS; Manufacturer: RALEC; Manufacturer Part No: RTT03R330FTP; Value: 0.33Ω; Package: 0603
RF1 = RC0603FR-072KL: RES SMD 2K OHM 1% 1/10W 0603; Manufacturer: Yageo; Resistance: 2kR; Temperature Coefficient: 100ppm/°C; Voltage Rating (DC): 50V; Power Rating: 100mW; Working Voltage: 75V; Supplier 1: Digi-Key; Manufacturer Part Number: RC0603FR-072KL; Stock 1: 8782961; Pricing 1: 1=0.1, 10=0.023, 100=0.0094, 1000=0.00421, 2500=0.00366 (USD); Case/Package: 0603; Number of Pins: 2; Case Code (Metric): 1608; Case Code (Imperial): 0603; Min Operating Temperature: -55°C; Max Operating Temperature: 155°C; Tolerance: 1%; Composition: Thick Film; Packaging: Tape and Reel; Voltage Rating: 50V; Package Quantity: 1; Number of Terminations: 2; Termination: SMD/SMT; Military Standard: Not; Max Power Dissipation: 100mW; Features: Moisture Resistant; Length: 1.6mm; Height: 0.45mm; Width: 0.031inch; Depth: 0.8mm; Lead Free: Lead Free; REACH SVHC: No SVHC; ComponentLink1URL: http://www.farnell.com/datasheets/2167052.pdf?src-supplier=Element14; ComponentLink1Description: http://www.farnell.com/datasheets/2167052.pdf?src-supplier=Element14; ComponentLink2URL: http://documents.rs-components.com/techlib://itc_doclist_GB.htm?stockno=5050139&src-supplier=RSComponents; ComponentLink2Description: http://documents.rs-components.com/techlib://itc_doclist_GB.htm?stockno=5050139&src-supplier=RSComponents; ComponentLink3URL: http://www.yageo.com/documents/recent/PYu-RC_Group_51_RoHS_L_10.pdf?src-supplier=Digi-Key; ComponentLink3Description: http://www.yageo.com/documents/recent/PYu-RC_Group_51_RoHS_L_10.pdf?src-supplier=Digi-Key; ComponentLink4URL: http://www.mouser.com/catalog/specsheets/RC0603.pdf?src-supplier=Mouser; ComponentLink4Description: http://www.mouser.com/catalog/specsheets/RC0603.pdf?src-supplier=Mouser; Supplier Part Number 1: 311-2.00KHRCT-ND
RF2 = 0603WAF1201T5E: ±1% 1/10W Thick Film Resistors 75V ±100ppm/℃ -55℃~+155℃ 1.2kΩ 0603 Chip Resistor - Surface Mount ROHS; Manufacturer: UNI-ROYAL; Manufacturer Part No: 0603WAF1201T5E; Value: 1.2kΩ; Package: 0603
U1 = MC34063ADR: 1.5-A boost, buck, inverting switching regulator, operation from 0°C to 70°C 8-SOIC 0 to 70; Manufacturer: Texas Instruments; Output Voltage: 40V; Number of Outputs: 1; Output Current: 1.5A; Switching Frequency: 100kHz; Synchronous Rectifier: No; Output Type: Adjustable; Max Output Current: 750mA; Min Input Voltage: 3V; Min Output Voltage: 1.55V; Quiescent Current: 4mA; Topology: Flyback,SEPIC; Supplier 1: Digi-Key; Manufacturer Part Number: MC34063ADR; RoHS: Yes; Category: Power Supply Modules; Stock 1: 17204; Pricing 1: 1=0.78000, 10=0.68400, 25=0.64240, 100=0.52420, 250=0.48688, 500=0.41438, 1000=0.34206 (USD); Case/Package: D; Number of Pins: 8; Weight: 0.002561oz; Contact Plating: Gold; Min Operating Temperature: 0°C; Max Operating Temperature: 70°C; Packaging: Tape and Reel; Package Quantity: 1; Max Input Voltage: 40V; Max Output Voltage: 40V; Termination: SMD/SMT; Radiation Hardening: No; RoHS Compliant: Yes; Lead Free: Lead Free; REACH SVHC: No SVHC; ComponentLink1URL: https://datasheet.ciiva.com/7408/1862376-7408060.pdf?src-supplier=Newark; ComponentLink1Description: https://datasheet.ciiva.com/7408/1862376-7408060.pdf?src-supplier=Newark; ComponentLink2URL: https://datasheet.ciiva.com/2025/mc33063a-2025162.pdf?src-supplier=Digi-Key; ComponentLink2Description: https://datasheet.ciiva.com/2025/mc33063a-2025162.pdf?src-supplier=Digi-Key; ComponentLink3URL: https://datasheet.ciiva.com/2025/mc33063a-2025161.pdf?src-supplier=Digi-Key; ComponentLink3Description: https://datasheet.ciiva.com/2025/mc33063a-2025161.pdf?src-supplier=Digi-Key; ComponentLink4URL: https://datasheet.ciiva.com/2025/mc33063a-2025163.pdf?src-supplier=Digi-Key; ComponentLink4Description: https://datasheet.ciiva.com/2025/mc33063a-2025163.pdf?src-supplier=Digi-Key; Supplier Part Number 1: 296-17765-1-ND

## Sheet Connector_Section.SchDoc
size A4; DocumentNumber: 5; SheetNumber: 5
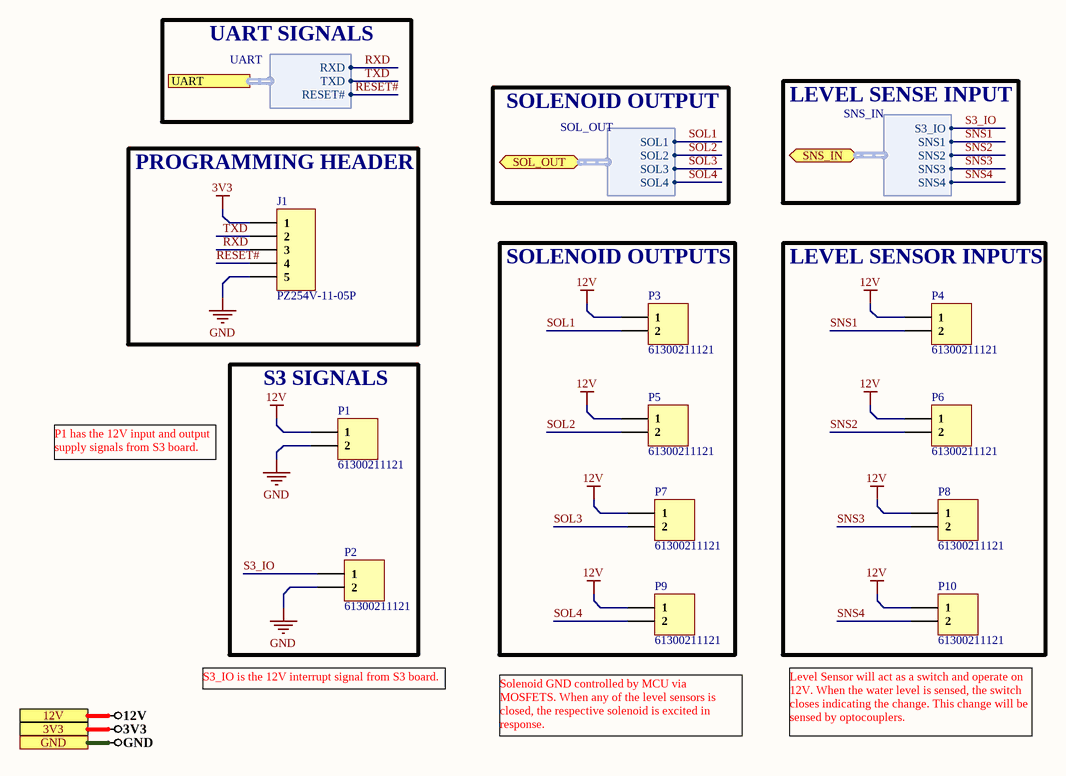
[diagram p4: Connector_Section.SchDoc]

### Parts
J1  PZ254V-11-05P  [HDR1X5]
P1  61300211121  [HDR1X2]
P2  61300211121  [HDR1X2]
P3  61300211121  [HDR1X2]
P4  61300211121  [HDR1X2]
P5  61300211121  [HDR1X2]
P6  61300211121  [HDR1X2]
P7  61300211121  [HDR1X2]
P8  61300211121  [HDR1X2]
P9  61300211121  [HDR1X2]
P10  61300211121  [HDR1X2]

### Blocks framed on the sheet
PROGRAMMING HEADER: J1
SOLENOID OUTPUTS: P3 P5 P7 P9
LEVEL SENSOR INPUTS: P4 P6 P8 P10
S3 SIGNALS: P1 P2

### Ports
3V3, 12V, GND, SNS_IN (bidir, harness SNS_IN), SOL_OUT (bidir, harness SOL_OUT), UART (harness UART)

### Harnesses
SNS_IN: S3_IO, SNS1, SNS2, SNS3, SNS4
SOL_OUT: SOL1, SOL2, SOL3, SOL4
UART: RXD, TXD, RESET#

### Nets
3V3: J1.1 ; port 3V3
12V: P1.1 P3.1 P4.1 P5.1 P6.1 P7.1 P8.1 P9.1 P10.1 ; port 12V
GND: J1.5 P1.2 P2.2 ; port GND
RESET#: J1.4 ; port UART.RESET#
RXD: J1.3 ; port UART.RXD
S3_IO: P2.1 ; port SNS_IN.S3_IO
SNS1: P4.2 ; port SNS_IN.SNS1
SNS2: P6.2 ; port SNS_IN.SNS2
SNS3: P8.2 ; port SNS_IN.SNS3
SNS4: P10.2 ; port SNS_IN.SNS4
SOL1: P3.2 ; port SOL_OUT.SOL1
SOL2: P5.2 ; port SOL_OUT.SOL2
SOL3: P7.2 ; port SOL_OUT.SOL3
SOL4: P9.2 ; port SOL_OUT.SOL4
TXD: J1.2 ; port UART.TXD

### Notes on the sheet
- UART SIGNALS
- SOLENOID OUTPUT
- LEVEL SENSE INPUT
- P1 has the 12V input and output supply signals from S3 board.
- S3_IO is the 12V interrupt signal from S3 board.
- Solenoid GND controlled by MCU via MOSFETS. When any of the level sensors is closed, the respective solenoid is excited in response.
- (near P10) Level Sensor will act as a switch and operate on 12V. When the water level is sensed, the switch closes indicating the change. This change will be sensed by optocouplers.

### Library data of the parts
J1 = PZ254V-11-05P: Pin Header 5 1 right-angle; Manufacturer: XFCN; Brand Category: Made In Asia Brands; Pitch: 2.54; Packaging: Bag-packed; Connector Type: Pin Header; Number of Pins: 5; Number of Rows: 1
P1-P10 = Header 1x2: CONN HEADER VERT 2POS 2.54MM; Manufacturer: Wurth Electronics; Current Rating: 3A; Voltage Rating: 250V; Number of Positions: 2; Gender: Male; Connector Type: Male Pin; Pitch: 0.1inch; Supplier 1: Digi-Key; Manufacturer Part Number: 61300211121; Stock 1: 219205; Pricing 1: 1=0.13, 10=0.106, 25=0.088, 50=0.074, 100=0.067, 1000=0.061 (USD); Mount: Through Hole; Contact Plating: Gold; Housing Material: PBT; Contact Material: Copper Alloy,Copper; Color: Black; Min Operating Temperature: -40°C; Max Operating Temperature: 125°C; Number of Rows: 1; Contact Gender: Male; Packaging: Bulk; Termination: Through Hole; Number of Contacts: 2; Contact Mating Length: 0.236inch; REACH SVHC: Unknown; Lead Free: Lead Free; ComponentLink1URL: http://www.mouser.com/ds/2/445/6130xx11121-538006.pdf?src-supplier=Mouser; ComponentLink1Description: http://www.mouser.com/ds/2/445/6130xx11121-538006.pdf?src-supplier=Mouser; Supplier Part Number 1: 732-5315-ND

## Nets that join several sheets
3V3: Controller_Section (L2.1), Peripheral_Section (5 pins), Power_Section (C2.1 L1.2 RF1.1), Connector_Section (J1.1)
12V: Power_Section (C1.1 R1.2 U1.6), Connector_Section (9 pins)
GND: Controller_Section (6 pins), Peripheral_Section (18 pins), Power_Section (6 pins), Connector_Section (J1.5 P1.2 P2.2)
MCU_IN1: Controller_Section (U2.20), Peripheral_Section (R4.1 U3.16)
MCU_IN2: Controller_Section (U2.1), Peripheral_Section (R5.1 U3.14)
MCU_IN3: Controller_Section (U2.5), Peripheral_Section (R6.1 U3.12)
MCU_IN4: Controller_Section (U2.6), Peripheral_Section (R7.1 U3.10)
MCU_IN5: Controller_Section (U2.13), Peripheral_Section (R9.1 U4.4)
MCU_OUT1: Controller_Section (U2.7), Peripheral_Section (Q1.1 R3.2)
MCU_OUT2: Controller_Section (U2.8), Peripheral_Section (Q2.1 R8.2)
MCU_OUT3: Controller_Section (U2.9), Peripheral_Section (Q3.1 R14.2)
MCU_OUT4: Controller_Section (U2.10), Peripheral_Section (Q4.1 R15.2)
RESET#: Controller_Section (R2.1), Connector_Section (J1.4)
RXD: Controller_Section (U2.11), Connector_Section (J1.3)
S3_IO: Peripheral_Section (U4.1), Connector_Section (P2.1)
SNS1: Peripheral_Section (U3.1), Connector_Section (P4.2)
SNS2: Peripheral_Section (U3.3), Connector_Section (P6.2)
SNS3: Peripheral_Section (U3.5), Connector_Section (P8.2)
SNS4: Peripheral_Section (U3.7), Connector_Section (P10.2)
SOL1: Peripheral_Section (Q1.3), Connector_Section (P3.2)
SOL2: Peripheral_Section (Q2.3), Connector_Section (P5.2)
SOL3: Peripheral_Section (Q3.3), Connector_Section (P7.2)
SOL4: Peripheral_Section (Q4.3), Connector_Section (P9.2)
TXD: Controller_Section (U2.12), Connector_Section (J1.2)